# Altium project AFE4950EVM-DC116A.PrjPcb (part 2 of 4)

## Sheet DC116A_BatteryMgmt.SchDoc: BatteryMgmt
size 431 x 279 mm; Date: Not shown in title block; ApprovedBy: Not shown in title block; CheckedBy: Not shown in title block; Author: Not shown in title block; CompanyName: Not shown in title block; DrawnBy: Midhun Raveendran; Engineer: Midhun Raveendran; Organization: Not shown in title block; Address1: Not shown in title block; Address2: Not shown in title block; Address3: Not shown in title block; Address4: Not shown in title block; DocumentNumber: 7; Revision: Use project parameter SCH_Rev; SheetNumber: 7; SheetTotal: 8; PageSetup: Record=PageOptions|CenterHorizontal=True|CenterVertical=True|PrintScale=1.00|XCorrection=1.00|YCorrection=1.00|PrintKind=0|BorderSize=5000000|LeftOffset=0|BottomOffset=0|Orientation=2|PaperLength=1000|PaperWidth=1000|Scale=100|PaperSource=15|PrintQuality=600|MediaType=1|DitherType=10|PaperKind=Letter|PrintScaleMode=1; CurrentTime: Not shown in title block; CurrentDate: Not shown in title block; Time: Not shown in title block; DocumentFullPathAndName: Not shown in title block; DocumentName: Not shown in title block; ModifiedDate: Not shown in title block; ImagePath: Not shown in title block; ProjectName: DC057A
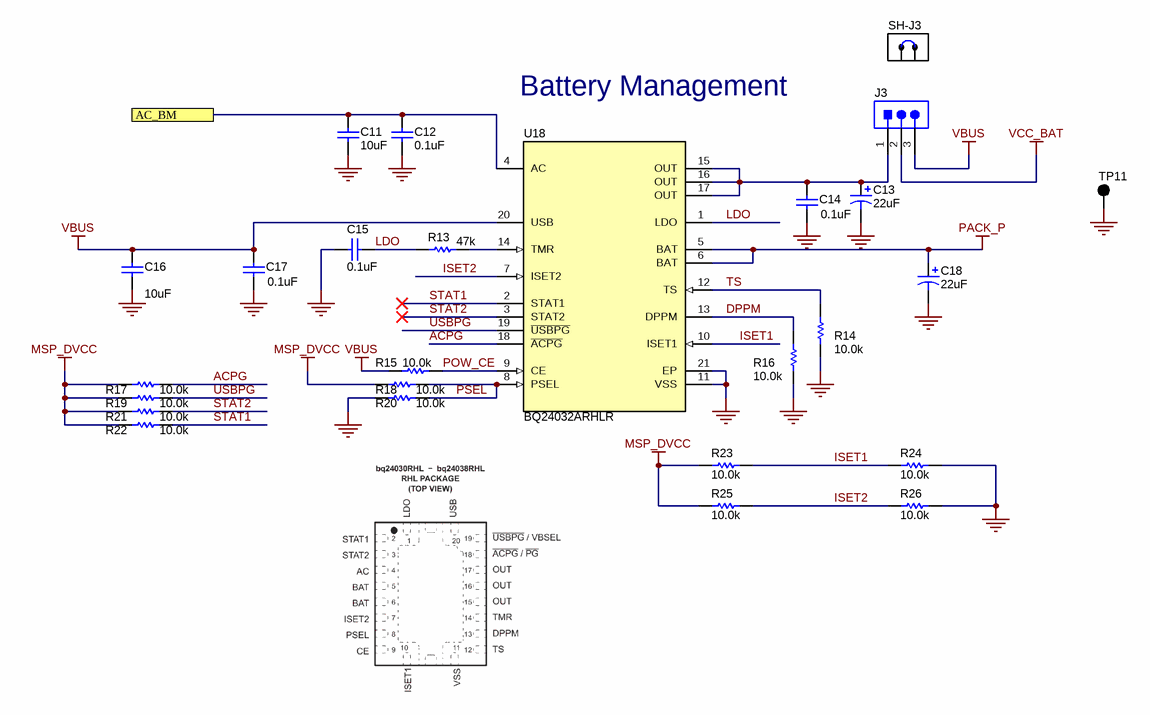
[diagram p3: DC116A_BatteryMgmt.SchDoc]

### Parts
C11  ValueDisplayed: 10uF  [0603]  (hidden comment: Capacitor)
C12  ValueDisplayed: 0.1uF  [0402]  (hidden comment: 0402YC104KAT2A)
C13  ValueDisplayed: 22uF  [2012-10]  (hidden comment: Cap_Polarized)
C14  ValueDisplayed: 0.1uF  [0402]  (hidden comment: 0402YC104KAT2A)
C15  ValueDisplayed: 0.1uF  [0402]  (hidden comment: 0402YC104KAT2A)
C16  ValueDisplayed: 10uF  [0603]  (hidden comment: EMK107BBJ106MA-T)
C17  ValueDisplayed: 0.1uF  [0402]  (hidden comment: 0402YC104KAT2A)
C18  ValueDisplayed: 22uF  [2012-10]  (hidden comment: Cap_Polarized)
J3  Header_3x1  [Samtec_TSW-103-07-T-S]  (value not drawn)
R13  ValueDisplayed: 47k  [0402]  (hidden comment: Resistor)
R14  ValueDisplayed: 10.0k  [0402]  (hidden comment: Resistor)
R15  ValueDisplayed: 10.0k  [0402]  (hidden comment: Resistor)
R16  ValueDisplayed: 10.0k  [0402]  (hidden comment: Resistor)
R17  ValueDisplayed: 10.0k  [0402]  (hidden comment: Resistor)
R18  ValueDisplayed: 10.0k  [0402]  (hidden comment: Resistor)
R19  ValueDisplayed: 10.0k  [0402]  (hidden comment: Resistor)
R20  ValueDisplayed: 10.0k  [0402]  (hidden comment: Resistor)
R21  ValueDisplayed: 10.0k  [0402]  (hidden comment: Resistor)
R22  ValueDisplayed: 10.0k  [0402]  (hidden comment: Resistor)
R23  ValueDisplayed: 10.0k  [0402]  (hidden comment: Resistor)
R24  ValueDisplayed: 10.0k  [0402]  (hidden comment: Resistor)
R25  ValueDisplayed: 10.0k  [0402]  (hidden comment: Resistor)
R26  ValueDisplayed: 10.0k  [0402]  (hidden comment: Resistor)
SH-J3  881545-2  [TE_881545-2]  (value not drawn)
TP11  5001  [Keystone5001]  (value not drawn)
U18  PartNumber: BQ24032ARHLR  [RHL0020A]  (hidden comment: TI-BQ24032ARHL20-3050X2050TP)

### Ports
AC_BM

### Nets
GND: C11.2 C12.2 C13.2(-) C14.1 C15.2 C16.2 C17.1 C18.2(-) R14.1 R16.2 R20.1 R24.2 R26.2 TP11.1 U18.11(VSS) U18.21(EP)
MSP_DVCC: R17.1 R18.1 R19.1 R21.1 R22.1 R23.1 R25.1
PACK_P: C18.1(+) U18.5(BAT) U18.6(BAT)
VBUS: C16.1 C17.2 J3.3 R15.1 U18.20(USB)
VCC_BAT: J3.2
AC_BM: C11.1 C12.1 U18.4(AC) ; port AC_BM
ACPG: R17.2 U18.18(~{ACPG})
DPPM: R16.1 U18.13(DPPM)
ISET1: R23.2 R24.1 U18.10(ISET1)
ISET2: R25.2 R26.1 U18.7(ISET2)
LDO: C15.1 R13.2 U18.1(LDO)
POW_CE: R15.2 U18.9(CE)
PSEL: R18.2 R20.2 U18.8(PSEL)
STAT1: R22.2 U18.2(STAT1)
STAT2: R21.2 U18.3(STAT2)
TS: R14.2 U18.12(TS)
USBPG: R19.2 U18.19(~{USBPG})
NetC13_1: C13.1(+) C14.2 J3.1 U18.15(OUT) U18.16(OUT) U18.17(OUT)
NetR13_1: R13.1 U18.14(TMR)

### Notes on the sheet
- Battery Management
- Drawn By:
- SVN Rev:
- Number:
- TID #:
- Orderable:
- Rev:
- Sheet Title:
- File:
- Project Title:
- Designed for:
- Assembly Variant:
- Mod. Date:
- Sheet:
- Size:
- of
- B
- http://www.ti.com
- Texas Instruments and/or its licensors do not warrant the accuracy or completeness of this specification or any information contained therein. Texas Instruments and/or its licensors do not warrant that this design will meet the specifications, will be suitable for your application or fit for any particular purpose, or will operate in an implementation. Texas Instruments and/or its licensors do not warrant that the design is production worthy. You should completely validate and test your design implementation to confirm the system functionality for your application.
- Engineer:
- Contact:
- © Texas Instruments

### Library data of the parts
C11 = CMP-0006872-5: CAP, CERM, 10 uF, 6.3 V, +/- 20%, X5R, 0603; PartNumber: C0603C106M9PACTU; Manufacturer: Kemet; Polarized: N; Value: 10uF; U/M: EA; Cap_F: 10µF; ESR_ohm: 4m; Value1: 0.004 ohm; VDC_V: 6.3V; IRMS_A: 8.9A; TaMin_C: -55°C; TaMax_C: 85°C; SizeArea_mm2: 1.28; SizeAreaWB_mm2: 4.68; SizeX_mm: 1.6; SizeY_mm: 0.8; SizeZ_mm: 1; AEC Category: Q200; CompType: Capacitor; PackageReference: 0603; RoHS: Y; Tolerance_%: 20%; Value2: 6.3V; MountType: SMT; Technology: Ceramic; TempCo: X5R; Cap_Case: 0603; Published: 2008-06-19; Publisher: Texas Instruments; LatestRevisionDate: 2017-03-09; ComponentLink1Description: Datasheet link; ComponentLink1URL: http://www.kemet.com/kemet/web/homepage/kechome.nsf/vapubfiles/F3102_Y5V.pdf/$file/F3102_Y5V.pdf; Supplier 1: Digi-Key; Supplier Part Number 1: 399-5504-1-ND; Supplier 2: Mouser; Supplier Part Number 2: 80-C0603C106M9P; Supplier 3: Farnell; Supplier Part Number 3: 1288201; AEC Qualified: ?
C12 C14 C15 C17 = CMP-0006201-2: CAP, CERM, 0.1 uF, 16 V, +/- 10%, X7R, 0402; Manufacturer: AVX; TaMin_C: -55°C; Polarized: N; SizeAreaWB_mm2: 3; Value1: Unknown; U/M: EA; Value: 0.1uF; TaMax_C: 125°C; SizeZ_mm: 0.6; SizeX_mm: 1; SizeY_mm: 0.5; Value2: 16V; Cap_F: 100nF; AEC Category: Q200; Supplier Part Number 2: 09R7024; Publisher: Texas Instruments; Supplier 2: Newark; Supplier Part Number 3: 581-0402YC104KAT2A; TempCo: X7R; Supplier 3: Mouser; Published: 2008-06-19; RoHS: Y; MountType: SMT; Supplier 1: Digi-Key; PackageReference: 0402; Tolerance_%: 10%; Cap_Case: 0402; SizeArea_mm2: 0.5; CompType: Capacitor; LatestRevisionDate: 2017-03-09; PartNumber: 0402YC104KAT2A; AEC Qualified: N; VDC_V: 16V; ComponentLink1Description: Datasheet link; AEC Grade: N/A; Supplier Part Number 1: 478-7888-1-ND; Technology: Ceramic; ComponentLink1URL: http://catalogs.avx.com/SurfaceMount.pdf
C13 C18 = CMP-0012039-2: CAP, TA, 22 uF, 6.3 V, +/- 20%, 5.4 ohm, SMD; PartNumber: TLJN226M006R5400; Manufacturer: AVX; Polarized: Y; CompType: Capacitor; Value: 22uF; U/M: EA; Cap_F: 22µF; Value1: 5.4 ohm; VDC_V: 6.3V; ESR_ohm: 5.4; TaMin_C: -55°C; TaMax_C: 125°C; AEC Category: Q200; AEC Qualified: N; SizeAreaWB_mm2: 6.75; SizeArea_mm2: 2.5; SizeX_mm: 2; SizeY_mm: 1.25; SizeZ_mm: 1; PackageReference: 2012-10; RoHS: Y; Tolerance_%: 20%; Value2: 6.3V; MountType: SMT; Technology: TA; Series: TLJ; Cap_Case: 2012-10; Publisher: Texas Instruments; LatestRevisionDate: 2017-03-09; LatestRevisionNote: Updated supplier links; ComponentLink1Description: Datasheet link; ComponentLink1URL: http://www.avx.com/docs/Catalogs/tlj.pdf; Supplier 1: Digi-Key; Supplier Part Number 1: 478-4768-1-ND; Supplier 2: Newark; Supplier Part Number 2: 95M7480; Supplier 3: Mouser; Supplier Part Number 3: 581-TLJN226M006R5400; AEC Grade: N/A
C16 = CMP-0007122-5: CAP, CERM, 10 uF, 16 V, +/- 20%, X5R, 0603; Manufacturer: Taiyo Yuden; TaMin_C: -55°C; Polarized: N; SizeAreaWB_mm2: 4.68; Value1: Unknown; U/M: EA; Value: 10uF; TaMax_C: 85°C; SizeZ_mm: 1; SizeX_mm: 1.6; SizeY_mm: 0.8; Value2: 16V; SizeArea_mm2: 1.28; Cap_F: 10µF; AEC Category: Q200; Supplier Part Number 2: 963-EMK107BBJ106MA-T; Publisher: Texas Instruments; Supplier 2: Mouser; TempCo: X5R; Published: 2008-06-19; RoHS: Y; MountType: SMT; Supplier 1: Digi-Key; PackageReference: 0603; Tolerance_%: 20%; Cap_Case: 0603; CompType: Capacitor; LatestRevisionDate: 2017-03-09; PartNumber: EMK107BBJ106MA-T; AEC Qualified: ?; VDC_V: 16V; ComponentLink1Description: Datasheet link; Supplier Part Number 1: 587-3238-1-ND; Technology: Ceramic; ComponentLink1URL: http://ds.yuden.co.jp/TYCOMPAS/ut/detail.do?productNo=EMK107BBJ106MA-T&dataUnit=M
J3 = CMP-0075530-2: Header, 2.54 mm, 3x1, Tin, TH; PartNumber: TSW-103-07-T-S; Manufacturer: Samtec; Pitch_mm: 2.54; Gender: Male; Shrouded: N; Row_Count: 1; Current_A: 6.3A; Voltage_V: 550V; Cert_CSA: Y; Green_Lifecycle: Active; Green_REACh: Passed; PackageReference: Header, 2.54 mm, 3x1, TH; ClassName: Header; CompType: Header; RoHS: Y; MountType: TH; ComponentLink1Description: Datasheet URL; ComponentLink1URL: http://www.samtec.com/ftppub/cpdf/TSW-XXX-XX-XXX-X-XX-XXX-MKT.pdf; Supplier 1: Digi-Key; Supplier Part Number 1: SAM1035-03-ND; Supplier 2: Newark; Supplier Part Number 2: 12P1325; Supplier 3: Farnell; Supplier Part Number 3: 2035682; Orientation: Vertical; PinCount: 3; ContactFinish: Tin; Color: Black; Cert_UL: Y; Cert_CULUS: N; Cert_VDE: N; Green_EU RoHS-2: Passed; Green_EU RoHS: Passed
R13 = CMP-0026935-3: RES, 47 k, 5%, 0.063 W, AEC-Q200 Grade 0, 0402; PartNumber: CRCW040247K0JNED; Manufacturer: Vishay-Dale; Value: 47k; Value_Code: 47k0; Power_W: 63mW; Value2: 0.063W; VDC_V: 50V; TempCo: 200 ppm/C; EIA_Code: E24; SizeArea_mm2: 0.5; SizeX_mm: 1; SizeZ_mm: 0.6; AEC Category: Q200; AEC Qualified: Y; AEC Grade: 0; CompType: Resistor; PackageReference: 0402; RoHS: E; Res_ohm: 47k; Tolerance_%: 5%; Value1: 5%; MountType: SMT; Technology: Thick Film; ComponentLink1Description: Datasheet link; ComponentLink1URL: http://www.vishay.com/docs/20035/dcrcwe3.pdf; Supplier 1: Digi-Key; Supplier Part Number 1: 541-47KJCT-ND; Supplier 2: Newark; Supplier Part Number 2: 52K7099; Supplier 3: Mouser; Supplier Part Number 3: 71-CRCW0402-J-47K-E3; SizeY_mm: 0.5
R14-R26 = CMP-0026658-1: RES, 10.0 k, 1%, 0.1 W, 0402; PartNumber: ERJ-2RKF1002X; Manufacturer: Panasonic; Value: 10.0k; Res_ohm: 10k; Value_Code: 10k0; Power_W: 100mW; Value2: 0.1W; VDC_V: 50V; TempCo: 100 ppm/C; EIA_Code: E96; U/M: EA; SizeArea_mm2: 0.5; SizeX_mm: 1; SizeZ_mm: 0.6; AEC Category: Q200; CompType: Resistor; PackageReference: 0402; RoHS: Y; Tolerance_%: 1%; Value1: 1%; MountType: SMT; Technology: Thick Film; Published: 2008-06-26; Publisher: Texas Instruments; LatestRevisionDate: 2017-03-09; ComponentLink1Description: Datasheet link; ComponentLink1URL: http://industrial.panasonic.com/www-data/pdf/AOA0000/AOA0000CE2.pdf; Supplier 1: Digi-Key; Supplier Part Number 1: P10.0KLCT-ND; Supplier 2: Newark; Supplier Part Number 2: 90W2949; Supplier 3: Mouser; Supplier Part Number 3: 667-ERJ-2RKF1002X; SizeY_mm: 0.5; AEC Qualified: ?
SH-J3 = CMP-0003677-2: as SH-8 on sheet DC116A_ECG; CompType: Shunt; PartNumber: 881545-2; RoHS: Y; PackageReference: Shunt 2 pos. 100 mil; MountType: N/A; ComponentLink1Description: Datasheet Link; ComponentLink1URL: http://www.te.com/commerce/DocumentDelivery/DDEController?Action=srchrtrv&DocNm=881545&DocType=Customer+Drawing&DocLang=English; Publisher: Texas Instruments; LatestRevisionDate: 2017-03-09; Supplier 1: Digi-Key; Supplier Part Number 1: A26242-ND; Supplier 2: Newark; Supplier Part Number 2: 26H2523; Supplier 3: Mouser; Supplier Part Number 3: 571-8815452; Key: 881545-2
TP11 = CMP-0055138-1: Test Point, Miniature, Black, TH; Manufacturer: Keystone; ContactFinish: Silver; CNHeader: FALSE; CT: TRUE; Green_Lifecycle: Active; Green_REACh: Passed; PartNumber: 5001; PackageReference: Black Miniature Testpoint; CompType: Test Point; RoHS: Y; MountType: TH; ComponentLink1Description: Datasheet URL; ComponentLink1URL: http://www.keyelco.com/userAssets/file/M60-2p60.pdf; Publisher: Texas Instruments; LatestRevisionDate: 26/05/2017; Supplier 1: Digi-Key; Supplier Part Number 1: 36-5001-ND; Supplier 2: Mouser; Supplier Part Number 2: 534-5001; Color: Black; Green_EU RoHS-2: Incomplete; Green_EU RoHS: Passed
U18 = CMP-0033973-2: Dual Input Li-Ion Charger with Dynamic Power Path, Output regulated to 4.4 V, Vbat 4.2 V, 4.3 V, -40 to 85 degC, 20-pin QFN (RHL), Green (RoHS & no Sb/Br); Manufacturer: Texas Instruments; Lead Acid: N; Li-Ion: Y; SubFamily: Battery Charge Management; Vin(Min)(V): 4.3; DatasheetVersion: SLUS618H; PackageVersion: revJ, Dec-2011; PackageReference: RHL0020A; PackageDescription: 20-Leads Plastic Quad Flatpack No-Lead, 4.5 x 3.5 x 0.9 mm Body, 0.5 mm Pitch, Exposed Pad; Eco-Plan: Green (RoHS & no Sb/Br); Li-Polymer: Y; NiCd: N; NiMH: N; Over Voltage Protection: N; ComponentLink1Description: Datasheet; ComponentLink1URL: http://www.ti.com/general/docs/lit/getliterature.tsp?genericPartNumber=BQ24032A&fileType=pdf; Mounting Technology: Surface Mount

## Sheet DC116A_Contd.SchDoc: LevelTranslators
size 431 x 279 mm; Date: Not shown in title block; ApprovedBy: Not shown in title block; CheckedBy: Not shown in title block; Author: Not shown in title block; CompanyName: Not shown in title block; DrawnBy: Midhun Raveendran; Engineer: Midhun Raveendran; Organization: Not shown in title block; Address1: Not shown in title block; Address2: Not shown in title block; Address3: Not shown in title block; Address4: Not shown in title block; DocumentNumber: 4; Revision: Use project parameter SCH_Rev; SheetNumber: 4; SheetTotal: 8; PageSetup: Record=PageOptions|CenterHorizontal=True|CenterVertical=True|PrintScale=1.00|XCorrection=1.00|YCorrection=1.00|PrintKind=0|BorderSize=5000000|LeftOffset=0|BottomOffset=0|Orientation=2|PaperLength=1000|PaperWidth=1000|Scale=100|PaperSource=15|PrintQuality=600|MediaType=1|DitherType=10|PaperKind=Letter|PrintScaleMode=1; CurrentTime: Not shown in title block; CurrentDate: Not shown in title block; Time: Not shown in title block; DocumentFullPathAndName: Not shown in title block; DocumentName: Not shown in title block; ModifiedDate: Not shown in title block; ImagePath: Not shown in title block; ProjectName: DC057A
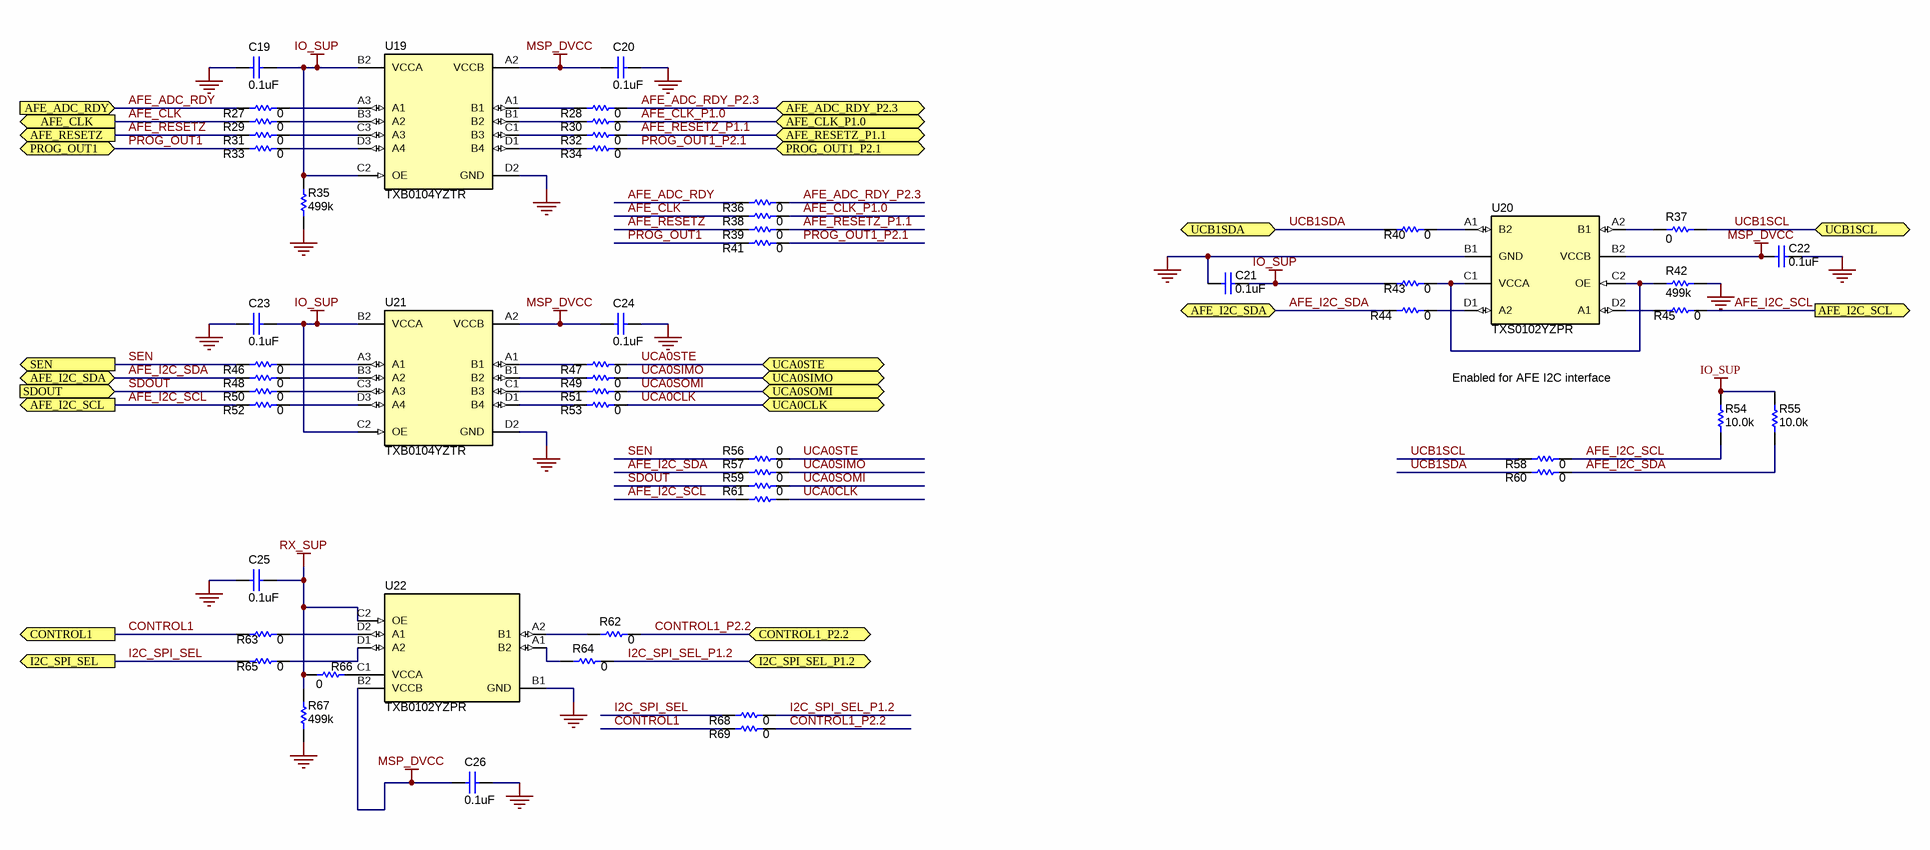
[diagram p4: DC116A_Contd.SchDoc]

### Parts
C19  ValueDisplayed: 0.1uF  [0402]  (hidden comment: 0402YC104KAT2A)
C20  ValueDisplayed: 0.1uF  [0402]  (hidden comment: 0402YC104KAT2A)
C21  ValueDisplayed: 0.1uF  [0402]  (hidden comment: 0402YC104KAT2A)
C22  ValueDisplayed: 0.1uF  [0402]  (hidden comment: 0402YC104KAT2A)
C23  ValueDisplayed: 0.1uF  [0402]  (hidden comment: 0402YC104KAT2A)
C24  ValueDisplayed: 0.1uF  [0402]  (hidden comment: 0402YC104KAT2A)
C25  ValueDisplayed: 0.1uF  [0402]  (hidden comment: 0402YC104KAT2A)
C26  ValueDisplayed: 0.1uF  [0402]  (hidden comment: 0402YC104KAT2A)
R27  ValueDisplayed: 0  [0201]  (hidden comment: Resistor)
R28  ValueDisplayed: 0  [0201]  (hidden comment: Resistor)
R29  ValueDisplayed: 0  [0201]  (hidden comment: Resistor)
R30  ValueDisplayed: 0  [0201]  (hidden comment: Resistor)
R31  ValueDisplayed: 0  [0201]  (hidden comment: Resistor)
R32  ValueDisplayed: 0  [0201]  (hidden comment: Resistor)
R33  ValueDisplayed: 0  [0201]  (hidden comment: Resistor)
R34  ValueDisplayed: 0  [0201]  (hidden comment: Resistor)
R35  ValueDisplayed: 499k  [0402]  (hidden comment: Resistor)
R36  ValueDisplayed: 0  [0402]  (hidden comment: Resistor)
R37  ValueDisplayed: 0  [0201]  (hidden comment: Resistor)
R38  ValueDisplayed: 0  [0402]  (hidden comment: Resistor)
R39  ValueDisplayed: 0  [0402]  (hidden comment: Resistor)
R40  ValueDisplayed: 0  [0201]  (hidden comment: Resistor)
R41  ValueDisplayed: 0  [0402]  (hidden comment: Resistor)
R42  ValueDisplayed: 499k  [0402]  (hidden comment: Resistor)
R43  ValueDisplayed: 0  [0201]  (hidden comment: Resistor)
R44  ValueDisplayed: 0  [0201]  (hidden comment: Resistor)
R45  ValueDisplayed: 0  [0201]  (hidden comment: Resistor)
R46  ValueDisplayed: 0  [0201]  (hidden comment: Resistor)
R47  ValueDisplayed: 0  [0201]  (hidden comment: Resistor)
R48  ValueDisplayed: 0  [0201]  (hidden comment: Resistor)
R49  ValueDisplayed: 0  [0201]  (hidden comment: Resistor)
R50  ValueDisplayed: 0  [0201]  (hidden comment: Resistor)
R51  ValueDisplayed: 0  [0201]  (hidden comment: Resistor)
R52  ValueDisplayed: 0  [0201]  (hidden comment: Resistor)
R53  ValueDisplayed: 0  [0201]  (hidden comment: Resistor)
R54  ValueDisplayed: 10.0k  [0402]  (hidden comment: Resistor)
R55  ValueDisplayed: 10.0k  [0402]  (hidden comment: Resistor)
R56  ValueDisplayed: 0  [0402]  (hidden comment: Resistor)
R57  ValueDisplayed: 0  [0402]  (hidden comment: Resistor)
R58  ValueDisplayed: 0  [0402]  (hidden comment: Resistor)
R59  ValueDisplayed: 0  [0402]  (hidden comment: Resistor)
R60  ValueDisplayed: 0  [0402]  (hidden comment: Resistor)
R61  ValueDisplayed: 0  [0402]  (hidden comment: Resistor)
R62  ValueDisplayed: 0  [0201]  (hidden comment: Resistor)
R63  ValueDisplayed: 0  [0201]  (hidden comment: Resistor)
R64  ValueDisplayed: 0  [0201]  (hidden comment: Resistor)
R65  ValueDisplayed: 0  [0201]  (hidden comment: Resistor)
R66  ValueDisplayed: 0  [0201]  (hidden comment: Resistor)
R67  ValueDisplayed: 499k  [0402]  (hidden comment: Resistor)
R68  ValueDisplayed: 0  [0402]  (hidden comment: Resistor)
R69  ValueDisplayed: 0  [0402]  (hidden comment: Resistor)
U19  PartNumber: TXB0104YZTR  [YZT0012ACAC]  (hidden comment: TXB0104YZT)
U20  PartNumber: TXS0102YZPR  [YZP0008ADCD]  (hidden comment: TXS0102YZP)
U21  PartNumber: TXB0104YZTR  [YZT0012ACAC]  (hidden comment: TXB0104YZT)
U22  PartNumber: TXB0102YZPR  [YZP0008ADAD]  (hidden comment: TI-TXB0102-YZP0008A-8)

### Ports
AFE_ADC_RDY (in), AFE_ADC_RDY_P2.3 (bidir), AFE_CLK (out), AFE_CLK_P1.0 (bidir), AFE_I2C_SCL (out), AFE_I2C_SDA (bidir), AFE_RESETZ (out), AFE_RESETZ_P1.1 (bidir), CONTROL1 (out), CONTROL1_P2.2 (bidir), I2C_SPI_SEL (out), I2C_SPI_SEL_P1.2 (bidir), PROG_OUT1 (bidir), PROG_OUT1_P2.1 (bidir), SDOUT (in), SEN (out), UCA0CLK (bidir), UCA0SIMO (bidir), UCA0SOMI (bidir), UCA0STE (bidir), UCB1SCL (bidir), UCB1SDA (bidir)

### Nets
GND: C19.2 C20.1 C21.1 C22.2 C23.2 C24.1 C25.2 C26.1 R35.1 R42.1 R67.1 U19.D2(GND) U20.B1(GND) U21.D2(GND) U22.B1(GND)
IO_SUP: C19.1 C21.2 C23.1 R35.2 R43.1 R54.2 R55.2 U19.B2(VCCA) U19.C2(OE) U21.B2(VCCA) U21.C2(OE)
MSP_DVCC: C20.2 C22.1 C24.2 C26.2 U19.A2(VCCB) U20.B2(VCCB) U21.A2(VCCB) U22.B2(VCCB)
RX_SUP: C25.1 R66.2 R67.2 U22.C2(OE)
AFE_ADC_RDY: R27.1 R36.2 ; port AFE_ADC_RDY
AFE_ADC_RDY_P2.3: R28.2 R36.1 ; port AFE_ADC_RDY_P2.3
AFE_CLK: R29.1 R38.1 ; port AFE_CLK
AFE_CLK_P1.0: R30.2 R38.2 ; port AFE_CLK_P1.0
AFE_I2C_SCL: R45.2 R52.1 R54.1 R58.2 R61.2 ; port AFE_I2C_SCL
AFE_I2C_SDA: R44.1 R48.1 R55.1 R57.1 R60.2 ; port AFE_I2C_SDA
AFE_RESETZ: R31.1 R39.1 ; port AFE_RESETZ
AFE_RESETZ_P1.1: R32.2 R39.2 ; port AFE_RESETZ_P1.1
CONTROL1: R63.1 R69.2 ; port CONTROL1
CONTROL1_P2.2: R62.2 R69.1 ; port CONTROL1_P2.2
I2C_SPI_SEL: R65.1 R68.1 ; port I2C_SPI_SEL
I2C_SPI_SEL_P1.2: R64.2 R68.2 ; port I2C_SPI_SEL_P1.2
PROG_OUT1: R33.1 R41.2 ; port PROG_OUT1
PROG_OUT1_P2.1: R34.2 R41.1 ; port PROG_OUT1_P2.1
SDOUT: R50.1 R59.1 ; port SDOUT
SEN: R46.1 R56.1 ; port SEN
UCA0CLK: R53.2 R61.1 ; port UCA0CLK
UCA0SIMO: R49.2 R57.2 ; port UCA0SIMO
UCA0SOMI: R51.2 R59.2 ; port UCA0SOMI
UCA0STE: R47.2 R56.2 ; port UCA0STE
UCB1SCL: R37.2 R58.1 ; port UCB1SCL
UCB1SDA: R40.1 R60.1 ; port UCB1SDA
NetR27_2: R27.2 U19.A3(A1)
NetR28_1: R28.1 U19.A1(B1)
NetR29_2: R29.2 U19.B3(A2)
NetR30_1: R30.1 U19.B1(B2)
NetR31_2: R31.2 U19.C3(A3)
NetR32_1: R32.1 U19.C1(B3)
NetR33_2: R33.2 U19.D3(A4)
NetR34_1: R34.1 U19.D1(B4)
NetR37_1: R37.1 U20.A2(B1)
NetR40_2: R40.2 U20.A1(B2)
NetR42_2: R42.2 R43.2 U20.C1(VCCA) U20.C2(OE)
NetR44_2: R44.2 U20.D1(A2)
NetR45_1: R45.1 U20.D2(A1)
NetR46_2: R46.2 U21.A3(A1)
NetR47_1: R47.1 U21.A1(B1)
NetR48_2: R48.2 U21.B3(A2)
NetR49_1: R49.1 U21.B1(B2)
NetR50_2: R50.2 U21.C3(A3)
NetR51_1: R51.1 U21.C1(B3)
NetR52_2: R52.2 U21.D3(A4)
NetR53_1: R53.1 U21.D1(B4)
NetR62_1: R62.1 U22.A2(B1)
NetR63_2: R63.2 U22.D2(A1)
NetR64_1: R64.1 U22.A1(B2)
NetR65_2: R65.2 U22.D1(A2)
NetR66_1: R66.1 U22.C1(VCCA)

### Notes on the sheet
- Enabled for AFE I2C interface
- Drawn By:
- SVN Rev:
- Number:
- TID #:
- Orderable:
- Rev:
- Sheet Title:
- File:
- Project Title:
- Designed for:
- Assembly Variant:
- Mod. Date:
- Sheet:
- Size:
- of
- B
- http://www.ti.com
- Texas Instruments and/or its licensors do not warrant the accuracy or completeness of this specification or any information contained therein. Texas Instruments and/or its licensors do not warrant that this design will meet the specifications, will be suitable for your application or fit for any particular purpose, or will operate in an implementation. Texas Instruments and/or its licensors do not warrant that the design is production worthy. You should completely validate and test your design implementation to confirm the system functionality for your application.
- Engineer:
- Contact:
- © Texas Instruments

### Library data of the parts
C19-C26 = CMP-0006201-2: as C12 on sheet DC116A_BatteryMgmt; Supplier Part Number 2: 09R7024; Publisher: Texas Instruments; Supplier 2: Newark; Supplier Part Number 3: 581-0402YC104KAT2A; TempCo: X7R; Supplier 3: Mouser; Published: 2008-06-19; RoHS: Y; MountType: SMT; Supplier 1: Digi-Key; PackageReference: 0402; Tolerance_%: 10%; Cap_Case: 0402; SizeArea_mm2: 0.5; CompType: Capacitor; LatestRevisionDate: 2017-03-09; PartNumber: 0402YC104KAT2A; AEC Qualified: N; VDC_V: 16V; ComponentLink1Description: Datasheet link; AEC Grade: N/A; Supplier Part Number 1: 478-7888-1-ND; Technology: Ceramic; ComponentLink1URL: http://catalogs.avx.com/SurfaceMount.pdf
R27-R34 R37 R40 R43-R53 R62-R66 = CMP-0027011-4: RES, 0, 5%, 0.05 W, AEC-Q200 Grade 1, 0201; PartNumber: ERJ-1GE0R00C; Manufacturer: Panasonic; Value: 0; Value_Code: 0000; Power_W: 50mW; Value2: 0.05W; VDC_V: 15V; TempCo: 600 ppm/C; SizeArea_mm2: 0.18; SizeX_mm: 0.6; SizeY_mm: 0.3; SizeZ_mm: 0.26; EIA_Code: E24; AEC Category: Q200; AEC Qualified: Y; AEC Grade: 1; SizeAreaWB_mm2: 2.08; CompType: Resistor; PackageReference: 0201; RoHS: Y; Res_ohm: 0; Tolerance_%: 5%; Value1: 5%; MountType: SMT; Technology: Thick Film; ComponentLink1Description: Datasheet link; ComponentLink1URL: https://industrial.panasonic.com/cdbs/www-data/pdf/RDA0000/AOA0000C301.pdf; Supplier 1: Digi-Key; Supplier Part Number 1: P0.0AGCT-ND; Supplier 2: Newark; Supplier Part Number 2: 53W4043; Supplier 3: Mouser; Supplier Part Number 3: 667-ERJ-1GE0R00C
R35 R42 R67 = CMP-0026401-2: RES, 499 k, 1%, 0.063 W, AEC-Q200 Grade 0, 0402; PartNumber: CRCW0402499KFKED; Manufacturer: Vishay-Dale; Value: 499k; Power_W: 63mW; Value2: 0.063W; VDC_V: 50V; TempCo: 100 ppm/C; SizeArea_mm2: 0.5; SizeX_mm: 1; SizeZ_mm: 0.6; EIA_Code: E96; AEC Category: Q200; AEC Qualified: Y; AEC Grade: 0; CompType: Resistor; PackageReference: 0402; RoHS: E; Res_ohm: 499k; Value_Code: 499k; Tolerance_%: 1%; Value1: 1%; MountType: SMT; Technology: Thick Film; SizeY_mm: 0.5; ComponentLink1Description: Datasheet link; ComponentLink1URL: http://www.vishay.com/docs/20035/dcrcwe3.pdf; Supplier 1: Digi-Key; Supplier Part Number 1: 541-499KLCT-ND; Supplier 2: Newark; Supplier Part Number 2: 52K7116; Supplier 3: Mouser; Supplier Part Number 3: 71-CRCW0402-499K-E3
R36 R38 R39 R41 R56-R61 R68 R69 = CMP-0026822-3: RES, 0, 5%, 0.063 W, AEC-Q200 Grade 0, 0402; PartNumber: CRCW04020000Z0ED; Manufacturer: Vishay-Dale; Value: 0; Value_Code: 0000; Power_W: 63mW; Value2: 0.063W; VDC_V: 50V; TempCo: 200 ppm/C; SizeArea_mm2: 0.5; SizeX_mm: 1; SizeZ_mm: 0.6; EIA_Code: E24; AEC Category: Q200; AEC Qualified: Y; CompType: Resistor; PackageReference: 0402; RoHS: E; Res_ohm: 0; Tolerance_%: 5%; Value1: 5%; MountType: SMT; Technology: Thick Film; SizeY_mm: 0.5; ComponentLink1Description: Datasheet link; ComponentLink1URL: http://www.vishay.com/docs/20035/dcrcwe3.pdf; Supplier 1: Digi-Key; Supplier Part Number 1: 541-0.0JCT-ND; Supplier 2: Newark; Supplier Part Number 2: 52K6543; Supplier 3: Mouser; Supplier Part Number 3: 71-CRCW0402-0-E3; AEC Grade: 0
R54 R55 = CMP-0025958-3: RES, 10.0 k, 1%, 0.063 W, AEC-Q200 Grade 0, 0402; PartNumber: CRCW040210K0FKED; Manufacturer: Vishay-Dale; Value: 10.0k; Res_ohm: 10k; Value_Code: 10k0; Power_W: 63mW; Value2: 0.063W; VDC_V: 50V; TempCo: 100 ppm/C; EIA_Code: E96; SizeArea_mm2: 0.5; SizeX_mm: 1; SizeZ_mm: 0.6; AEC Category: Q200; AEC Qualified: Y; AEC Grade: 0; CompType: Resistor; PackageReference: 0402; RoHS: E; Tolerance_%: 1%; Value1: 1%; MountType: SMT; Technology: Thick Film; ComponentLink1Description: Datasheet link; ComponentLink1URL: http://www.vishay.com/docs/20035/dcrcwe3.pdf; Supplier 1: Digi-Key; Supplier Part Number 1: 541-10.0KLCT-ND; Supplier 2: Newark; Supplier Part Number 2: 52K6595; Supplier 3: Mouser; Supplier Part Number 3: 71-CRCW0402-10K-E3; SizeY_mm: 0.5
U19 U21 = CMP-0067442-1: 4-Bit Bidirectional Voltage-Level Shifter with Auto Direction Sensing and +/-15 kV ESD Protect, YZT0012ACAC (DSBGA-12); Manufacturer: Texas Instruments; SizeArea_mm2: 3.9375; SizeAreaWB_mm2: 8.9375; SizeX_mm: 1.75; SizeY_mm: 2.25; SizeZ_mm: 0.625; CompType: IC; U/M: EA; PackageReference: YZT0012ACAC; PackageDescription: DSBGA-12; MountType: SMT; ComponentLink1Description: Datasheet Link; ComponentLink1URL: http://www.ti.com/lit/ds/symlink/txb0104.pdf; RoHS: Y; Publisher: Texas Instruments; LatestRevisionDate: 2017-06-09; Alternate Manufacturer: Texas Instruments; Footprint Path 6: C:\AltiumLibraries\Footprints\TI\.PcbLib
U20 = CMP-0067438-2: 2-Bit Bidirectional Voltage-Level Shifter for Open-Drain and Push-Pull Application, YZP0008ADCD (DSBGA-8); Manufacturer: Texas Instruments; SizeArea_mm2: 2.8125; SizeAreaWB_mm2: 7.3125; SizeX_mm: 1.25; SizeY_mm: 2.25; SizeZ_mm: 0.5; CompType: IC; U/M: EA; PackageReference: YZP0008ADCD; PackageDescription: DSBGA-8; MountType: SMT; ComponentLink1Description: Datasheet Link; ComponentLink1URL: http://www.ti.com/lit/ds/symlink/txs0102.pdf; RoHS: Y; Publisher: Texas Instruments; LatestRevisionDate: 2017-06-09; Alternate Manufacturer: Texas Instruments
U22 = CMP-0051208-2: 2-Bit Bidirectional Voltage-Level Translator with Auto Direction Sensing and +/-15-kV ESD Protect, YZP0008ADAD, LARGE T&R; Manufacturer: Texas Instruments; 3-State Output: No; Bits(#): 2; ICC @ Nom Voltage(Max)(mA): 0.005; Input Type: CMOS/TTL; Logic: True; Output Type: CMOS; Rating: Catalog; Sub-Family: Dual Supply Translator; tpd @ Nom Voltage(Max)(ns): 4.9; VCC(Max)(V): 5.5; VCC(Min)(V): 1.2; Voltage(Nom)(V): 3.3; PackageReference: YZP0008ADAD; DatasheetVersion: SCES641C; Generic Part Number: TXB0102; Operating Temperature Range(C): -40 to 85; Schmitt Trigger: No